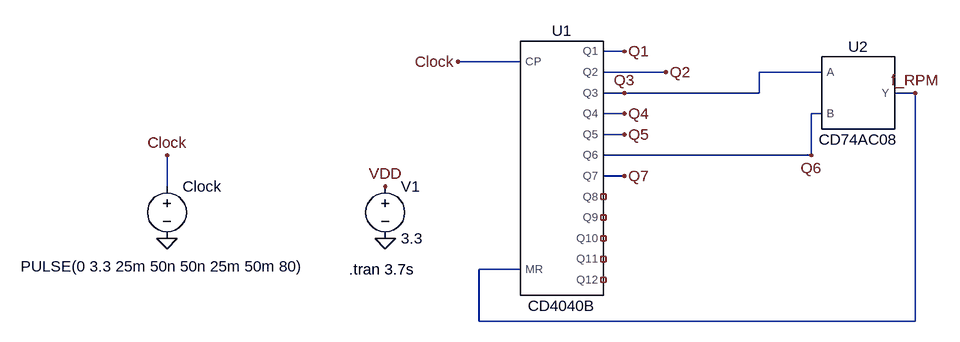
[diagram p0: schematic FrequencyDivider.asc]
FrequencyDivider.asc, the LTspice schematic file:
Version 4
SHEET 1 2252 832
WIRE 432 -32 400 -32
WIRE 272 -16 176 -16
WIRE 496 0 400 0
WIRE 736 0 640 0
WIRE 432 32 400 32
WIRE 640 32 640 0
WIRE 640 32 432 32
WIRE 880 32 848 32
WIRE 432 64 400 64
WIRE 736 64 720 64
WIRE 432 96 400 96
WIRE 720 128 720 64
WIRE 720 128 400 128
WIRE 432 160 400 160
WIRE -272 176 -272 128
WIRE 272 304 208 304
WIRE 208 384 208 304
WIRE 880 384 880 32
WIRE 880 384 208 384
FLAG -272 256 0
FLAG 64 256 0
FLAG 64 176 VDD
FLAG -272 128 Clock
FLAG 176 -16 Clock
FLAG 432 -32 Q1
FLAG 432 32 Q3
FLAG 496 0 Q2
FLAG 432 64 Q4
FLAG 432 96 Q5
FLAG 720 128 Q6
FLAG 432 160 Q7
FLAG 880 32 f_RPM
SYMBOL voltage 64 160 R0
SYMATTR InstName V1
SYMATTR Value 3.3
SYMBOL voltage -272 160 R0
WINDOW 3 -225 139 Left 2
SYMATTR Value PULSE(0 3.3 25m 50n 50n 25m 50m 80)
SYMATTR InstName Clock
SYMBOL CD4040B 336 208 R0
SYMATTR InstName U1
SYMBOL CD74AC08 784 32 R0
SYMATTR InstName U2
TEXT 8 304 Left 2 !.tran 3.7s

The netlist it stands for:
* FrequencyDivider.asc
V1 VDD 0 3.3
V§Clock Clock 0 PULSE(0 3.3 25m 50n 50n 25m 50m 80)
XU1 f_RPM Clock Q1 Q2 Q3 Q4 Q5 Q6 Q7 NC_01 NC_02 NC_03 NC_04 NC_05 VDD 0 CD4040B VDD=3.3 SPEED=0.1 TRIPDT=1e-9  ; pins MR CP Q1 Q2 Q3 Q4 Q5 Q6 Q7 Q8 Q9 Q10 Q11 Q12
XU2 f_RPM Q3 Q6 VDD 0 CD74AC08 VDD=3.3 SPEED=0.1 TRIPDT=1e-9  ; pins Y A B
.tran 3.7s
.lib CD4000_v.lib
.lib CD74AC08.cir
.backanno
.end